# Altium schematic sheet SENSOR_ARRAY.SchDoc
size A4; SheetNumber: 1; SheetTotal: 2
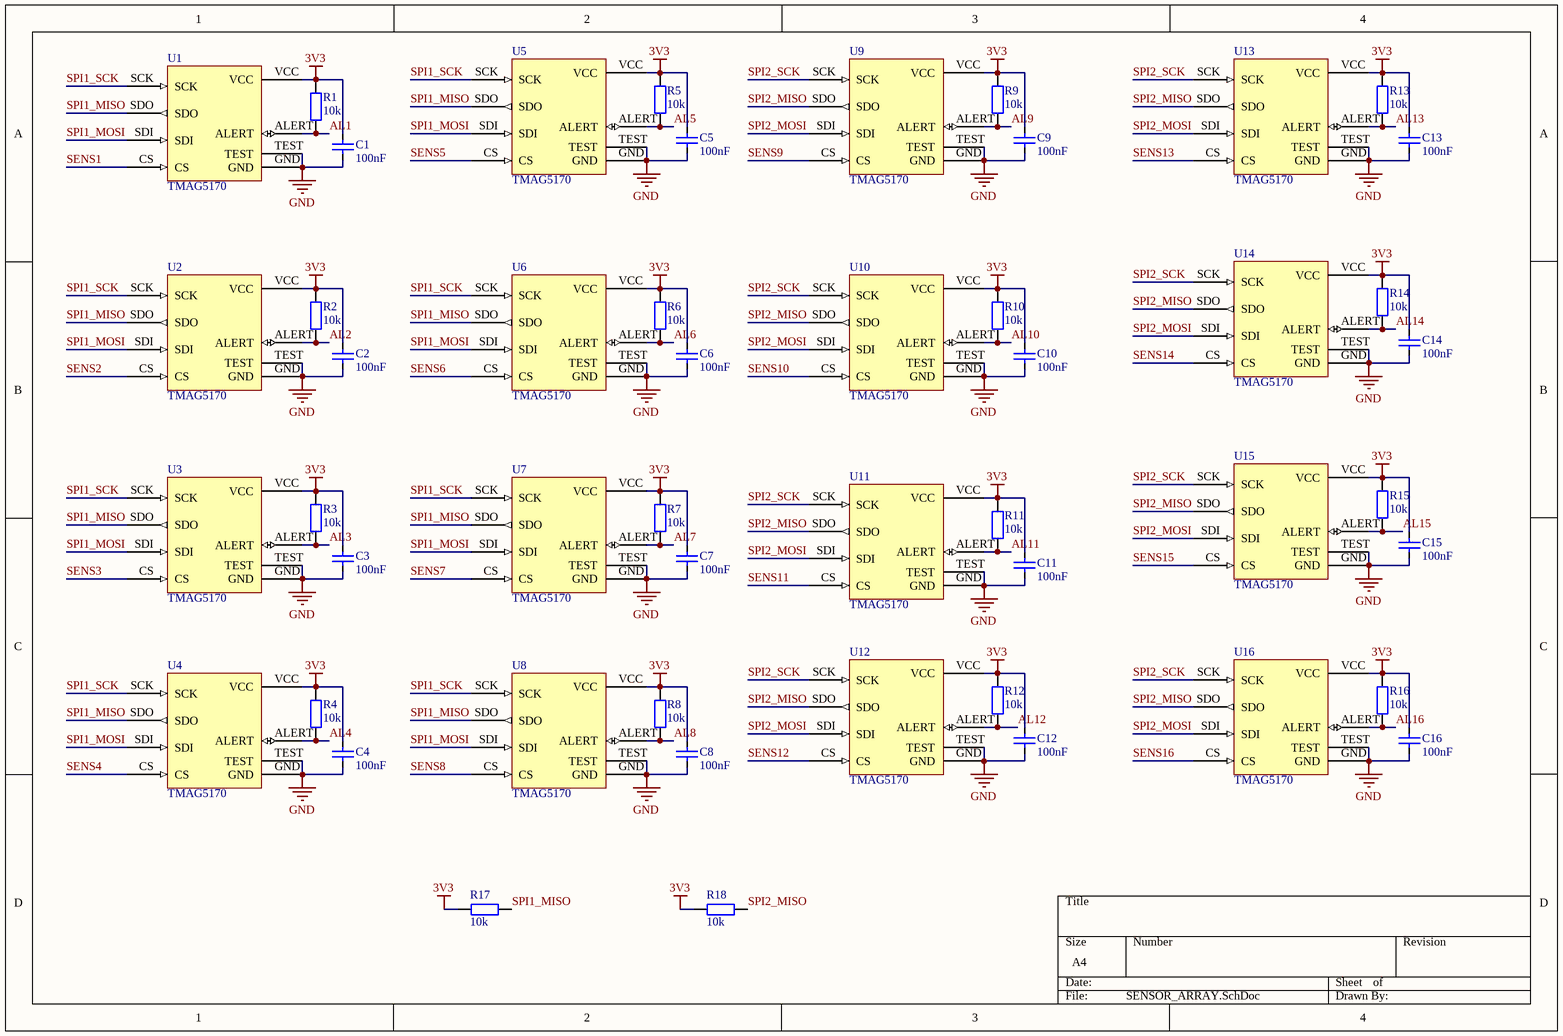
[diagram p0: SENSOR_ARRAY.SchDoc]

## Parts
C1  100nF  [CAP_0603]
C2  100nF  [CAP_0603]
C3  100nF  [CAP_0603]
C4  100nF  [CAP_0603]
C5  100nF  [CAP_0603]
C6  100nF  [CAP_0603]
C7  100nF  [CAP_0603]
C8  100nF  [CAP_0603]
C9  100nF  [CAP_0603]
C10  100nF  [CAP_0603]
C11  100nF  [CAP_0603]
C12  100nF  [CAP_0603]
C13  100nF  [CAP_0603]
C14  100nF  [CAP_0603]
C15  100nF  [CAP_0603]
C16  100nF  [CAP_0603]
R1  10k  [RES-SMD-0603]
R2  10k  [RES-SMD-0603]
R3  10k  [RES-SMD-0603]
R4  10k  [RES-SMD-0603]
R5  10k  [RES-SMD-0603]
R6  10k  [RES-SMD-0603]
R7  10k  [RES-SMD-0603]
R8  10k  [RES-SMD-0603]
R9  10k  [RES-SMD-0603]
R10  10k  [RES-SMD-0603]
R11  10k  [RES-SMD-0603]
R12  10k  [RES-SMD-0603]
R13  10k  [RES-SMD-0603]
R14  10k  [RES-SMD-0603]
R15  10k  [RES-SMD-0603]
R16  10k  [RES-SMD-0603]
R17  10k  [RES-SMD-0603]
R18  10k  [RES-SMD-0603]
U1  TMAG5170  [SOP8]
U2  TMAG5170  [SOP8]
U3  TMAG5170  [SOP8]
U4  TMAG5170  [SOP8]
U5  TMAG5170  [SOP8]
U6  TMAG5170  [SOP8]
U7  TMAG5170  [SOP8]
U8  TMAG5170  [SOP8]
U9  TMAG5170  [SOP8]
U10  TMAG5170  [SOP8]
U11  TMAG5170  [SOP8]
U12  TMAG5170  [SOP8]
U13  TMAG5170  [SOP8]
U14  TMAG5170  [SOP8]
U15  TMAG5170  [SOP8]
U16  TMAG5170  [SOP8]

## Nets
3V3: C1.2 C2.2 C3.2 C4.2 C5.2 C6.2 C7.2 C8.2 C9.2 C10.2 C11.2 C12.2 C13.2 C14.2 C15.2 C16.2 R1.1 R2.1 R3.1 R4.1 R5.1 R6.1 R7.1 R8.1 R9.1 R10.1 R11.1 R12.1 R13.1 R14.1 R15.1 R16.1 R17.1 R18.1 U1.VCC U2.VCC U3.VCC U4.VCC U5.VCC U6.VCC U7.VCC U8.VCC U9.VCC U10.VCC U11.VCC U12.VCC U13.VCC U14.VCC U15.VCC U16.VCC
GND: C1.1 C2.1 C3.1 C4.1 C5.1 C6.1 C7.1 C8.1 C9.1 C10.1 C11.1 C12.1 C13.1 C14.1 C15.1 C16.1 U1.GND U1.TEST U2.GND U2.TEST U3.GND U3.TEST U4.GND U4.TEST U5.GND U5.TEST U6.GND U6.TEST U7.GND U7.TEST U8.GND U8.TEST U9.GND U9.TEST U10.GND U10.TEST U11.GND U11.TEST U12.GND U12.TEST U13.GND U13.TEST U14.GND U14.TEST U15.GND U15.TEST U16.GND U16.TEST
AL1: R1.2 U1.ALERT
AL2: R2.2 U2.ALERT
AL3: R3.2 U3.ALERT
AL4: R4.2 U4.ALERT
AL5: R5.2 U5.ALERT
AL6: R6.2 U6.ALERT
AL7: R7.2 U7.ALERT
AL8: R8.2 U8.ALERT
AL9: R9.2 U9.ALERT
AL10: R10.2 U10.ALERT
AL11: R11.2 U11.ALERT
AL12: R12.2 U12.ALERT
AL13: R13.2 U13.ALERT
AL14: R14.2 U14.ALERT
AL15: R15.2 U15.ALERT
AL16: R16.2 U16.ALERT
SENS1: U1.CS
SENS2: U2.CS
SENS3: U3.CS
SENS4: U4.CS
SENS5: U5.CS
SENS6: U6.CS
SENS7: U7.CS
SENS8: U8.CS
SENS9: U9.CS
SENS10: U10.CS
SENS11: U11.CS
SENS12: U12.CS
SENS13: U13.CS
SENS14: U14.CS
SENS15: U15.CS
SENS16: U16.CS
SPI1_MISO: R17.2 U1.SDO U2.SDO U3.SDO U4.SDO U5.SDO U6.SDO U7.SDO U8.SDO
SPI1_MOSI: U1.SDI U2.SDI U3.SDI U4.SDI U5.SDI U6.SDI U7.SDI U8.SDI
SPI1_SCK: U1.SCK U2.SCK U3.SCK U4.SCK U5.SCK U6.SCK U7.SCK U8.SCK
SPI2_MISO: R18.2 U9.SDO U10.SDO U11.SDO U12.SDO U13.SDO U14.SDO U15.SDO U16.SDO
SPI2_MOSI: U9.SDI U10.SDI U11.SDI U12.SDI U13.SDI U14.SDI U15.SDI U16.SDI
SPI2_SCK: U9.SCK U10.SCK U11.SCK U12.SCK U13.SCK U14.SCK U15.SCK U16.SCK

## Library data of the parts
C1-C16 = CapSMD: Capacitor; Value: 33p; Published: 8-Jun-2000; LatestRevisionDate: 17-Jul-2002; LatestRevisionNote: Re-released for DXP Platform.; PackageReference: RAD-0.3; Publisher: Altium Limited
R1-R18 = Resistor - SMD: Resistor SMD; Manufacturer: Generic Components; Class: Passive; Published: 08/06/2000; Publisher: Altium Hobart Technology Centre